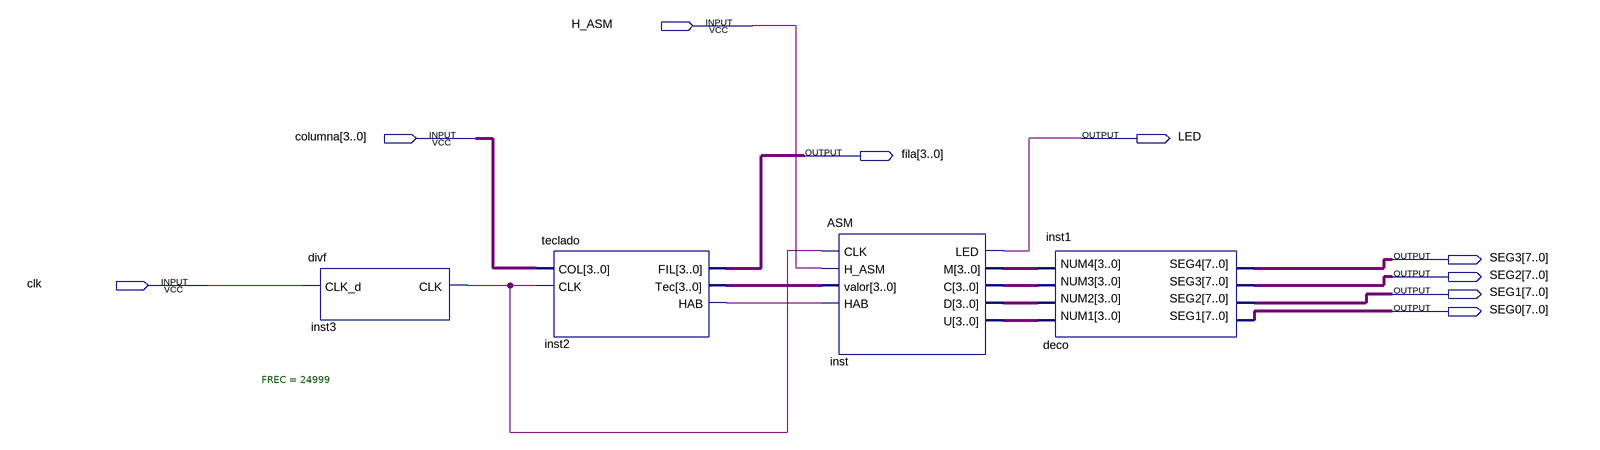
[diagram p0: schematic sheet]
// Quartus schematic T2.bdf as structural Verilog: 4 symbols, 9 pins
module T2 (
  input  H_ASM,
  input  [3:0] columna,
  input  clk,
  output LED,
  output [3:0] fila,
  output [7:0] SEG3,
  output [7:0] SEG2,
  output [7:0] SEG1,
  output [7:0] SEG0
);

  wire inst2_hab, inst3_clk;
  wire [3:0] inst2_tec, inst_c, inst_d, inst_m, inst_u;

  divf #(.FREC(24999)) inst3 (.CLK_d(clk), .CLK(inst3_clk));
  teclado inst2 (.COL(columna), .CLK(inst3_clk), .FIL(fila), .Tec(inst2_tec), .HAB(inst2_hab));
  ASM inst (
    .CLK(inst3_clk), .H_ASM(H_ASM), .valor(inst2_tec), .HAB(inst2_hab), .LED(LED), .M(inst_m), .C(inst_c),
    .D(inst_d), .U(inst_u));
  deco inst1 (
    .NUM1(inst_u), .NUM2(inst_d), .NUM3(inst_c), .NUM4(inst_m), .SEG1(SEG0), .SEG2(SEG1), .SEG3(SEG2),
    .SEG4(SEG3));
endmodule
